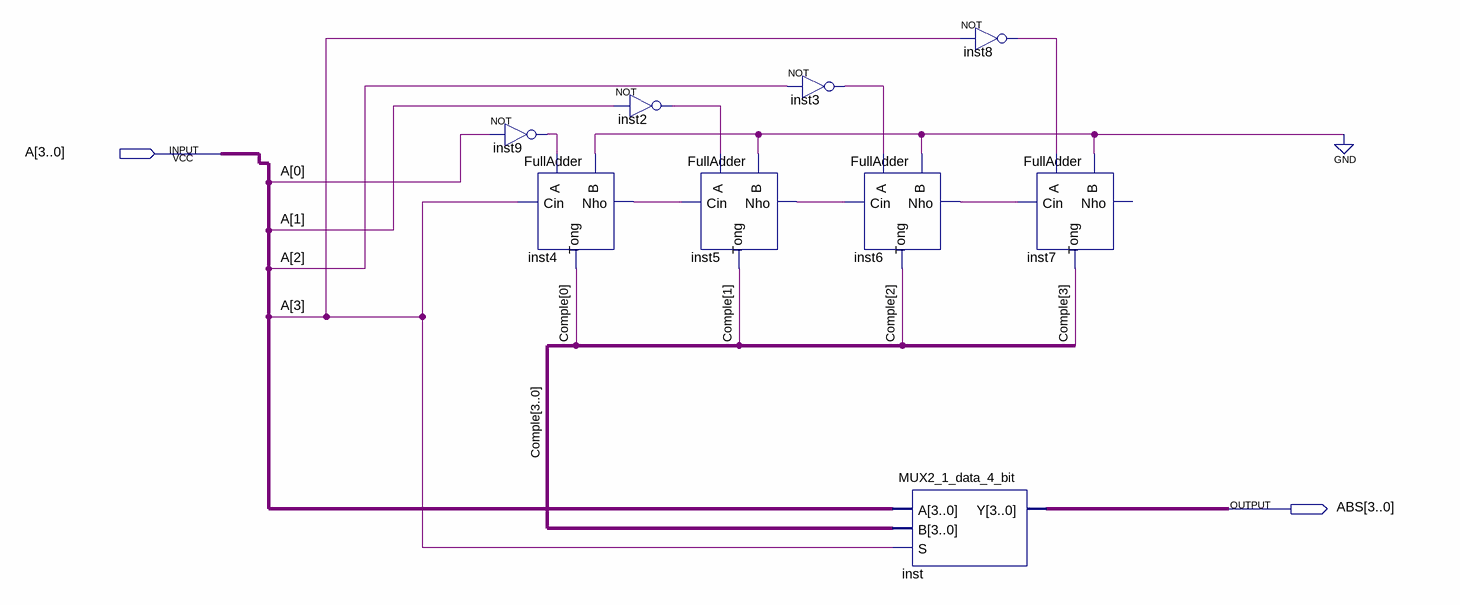
[diagram p0: schematic sheet]
// Quartus schematic ABS.bdf as structural Verilog: 9 symbols, 2 pins
module ABS (
  input  [3:0] A,
  output [3:0] ABS
);

  wire inst2_out, inst3_out, inst4_nho, inst5_nho, inst6_nho, inst8_out, inst9_out;
  wire [3:0] Comple;

  not inst9 (inst9_out, A[0]);
  FullAdder inst4 (.Cin(A[3]), .A(inst9_out), .B(1'b0), .Tong(Comple[0]), .Nho(inst4_nho));
  not inst2 (inst2_out, A[1]);
  FullAdder inst5 (.Cin(inst4_nho), .A(inst2_out), .B(1'b0), .Tong(Comple[1]), .Nho(inst5_nho));
  not inst3 (inst3_out, A[2]);
  FullAdder inst6 (.Cin(inst5_nho), .A(inst3_out), .B(1'b0), .Tong(Comple[2]), .Nho(inst6_nho));
  MUX2_1_data_4_bit inst (.A(A), .B(Comple), .S(A[3]), .Y(ABS));
  not inst8 (inst8_out, A[3]);
  FullAdder inst7 (.Cin(inst6_nho), .A(inst8_out), .B(1'b0), .Tong(Comple[3]));  // open: Nho
endmodule
